# Altium schematic sheet MCU.SchDoc
size A3; Date: 9/10/2026; DrawnBy: Juan Alejandro Villodres Perdomo; Revision: 0.1; SheetNumber: 3; SheetTotal: 3
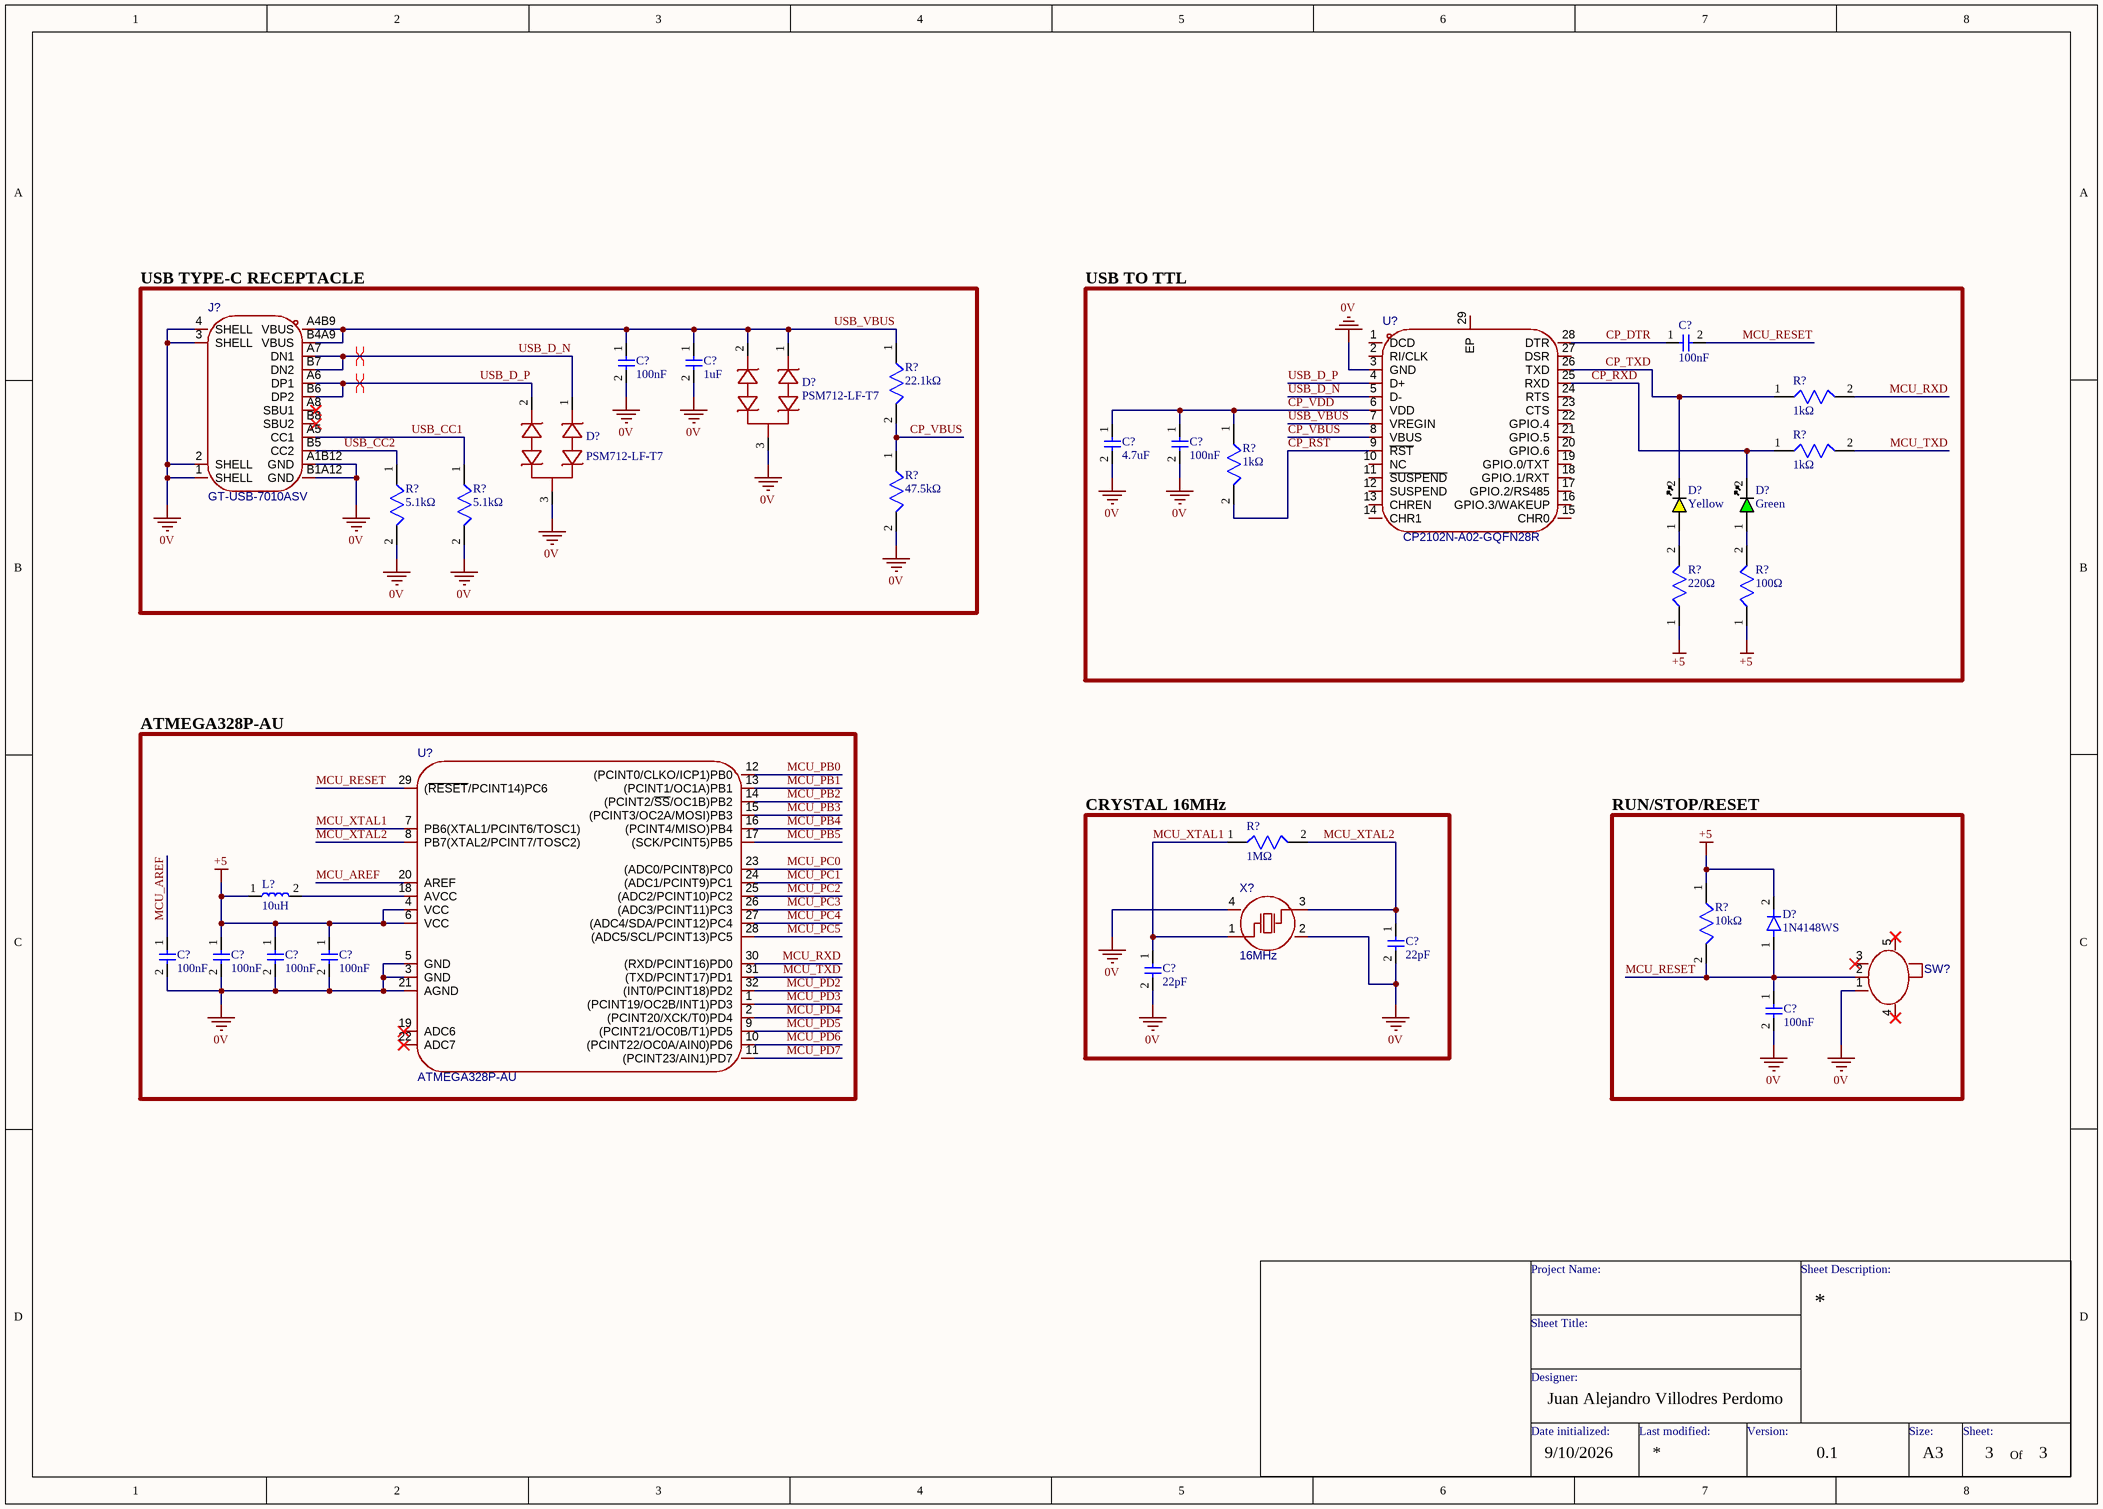
[diagram p0: MCU.SchDoc]

## Parts
(Parts that share a designator on the sheet are numbered #1, #2 ... from top to bottom, then left to right.)
C?#1  100nF  [CAPC1005X55N]
C?#2  100nF  [CAPC1608X90N]
C?#3  1uF  [CAPC1608X90N]
C?#4  4.7uF  [CAPC1005X55N]
C?#5  100nF  [CAPC1005X55N]
C?#6  22pF  [CAPC1005X55L]
C?#7  100nF  [CAPC1608X90N]
C?#8  100nF  [CAPC1608X90N]
C?#9  100nF  [CAPC1608X90N]
C?#10  100nF  [CAPC1608X90N]
C?#11  22pF  [CAPC1005X55L]
C?#12  100nF  [CAPC1608X90N]
D?#1  PSM712-LF-T7  [SOT95P230X121-3N]
D?#2  PSM712-LF-T7  [SOT95P230X121-3N]
D?#3  Yellow  [LED0805-R-RD]
D?#4  Green  [LED0805-R-RD]
D?#5  1N4148WS  [SOD-323_L1.8-W1.3-LS2.5-RD]
J?  GT-USB-7010ASV  [USB-C-SMD_G-SWITCH_GT-USB-7010ASV]
L?  10uH  [INDC3216X110N]
R?#1  22.1kΩ  [RESC1005X37N]
R?#2  1kΩ  [RESC1005X37N]
R?#3  1kΩ  [RESC1005X37N]
R?#4  1kΩ  [RESC1005X37N]
R?#5  47.5kΩ  [RESC1005X37N]
R?#6  5.1kΩ  [RESC1608X47L]
R?#7  5.1kΩ  [RESC1608X47L]
R?#8  220Ω  [RESC1608X47L]
R?#9  100Ω  [RESC1608X47L]
R?#10  1MΩ  [RESC1005X37N]
R?#11  10kΩ  [RESC1005X37N]
SW?  SS12D07VG4 087  [SW-TH_SS12D07VG4]  (value not drawn)
U?#1  CP2102N-A02-GQFN28R  [QFN-28_L5.0-W5.0-P0.50-TL-EP3.3]
U?#2  ATMEGA328P-AU  [TQFP-32_L7.0-W7.0-P0.80-LS9.0-BL]
X?  16MHz  [CRYSTAL-SMD_4P-L3.2-W2.5-BL]

## Blocks framed on the sheet
USB TYPE-C RECEPTACLE: C?#2 C?#3 D?#1 D?#2 J? R?#1 R?#5-R?#7
USB TO TTL: C?#1 C?#4 C?#5 D?#3 D?#4 R?#2-R?#4 R?#8 R?#9 U?#1
ATMEGA328P-AU: C?#7-C?#10 L? U?#2
CRYSTAL 16MHz: C?#6 C?#11 R?#10 X?
RUN/STOP/RESET: C?#12 D?#5 R?#11 SW?

## Nets
0V: C?#2.2 C?#3.2 C?#4.2 C?#5.2 C?#6.2 C?#7.2 C?#8.2 C?#9.2 C?#10.2 C?#11.2 C?#12.2 D?#1.3 D?#2.3 J?.1(SHELL) J?.2(SHELL) J?.3(SHELL) J?.4(SHELL) J?.A1B12(GND) J?.B1A12(GND) R?#5.2 R?#6.2 R?#7.2 SW?.1 U?#1.3(GND) U?#2.3(GND) U?#2.5(GND) U?#2.21(AGND) X?.2(GND) X?.4(GND)
+5: C?#8.1 C?#9.1 C?#10.1 D?#5.2(K) L?.1 R?#8.1 R?#9.1 R?#11.1 U?#2.4(VCC) U?#2.6(VCC)
CP_DTR: C?#1.1 U?#1.28(DTR)
CP_RST: R?#4.2 U?#1.9(~{RST})
CP_RXD: D?#4.2(K) R?#3.1 U?#1.25(RXD)
CP_TXD: D?#3.2(K) R?#2.1 U?#1.26(TXD)
CP_VBUS: R?#1.2 R?#5.1 U?#1.8(VBUS)
CP_VDD: C?#4.1 C?#5.1 R?#4.1 U?#1.6(VDD)
MCU_AREF: C?#7.1 U?#2.20(AREF)
MCU_PB0: U?#2.12((PCINT0/CLKO/ICP1)PB0)
MCU_PB1: U?#2.13((PCINT1/OC1A)PB1)
MCU_PB2: U?#2.14((PCINT2/~{SS}/OC1B)PB2)
MCU_PB3: U?#2.15((PCINT3/OC2A/MOSI)PB3)
MCU_PB4: U?#2.16((PCINT4/MISO)PB4)
MCU_PB5: U?#2.17((SCK/PCINT5)PB5)
MCU_PC0: U?#2.23((ADC0/PCINT8)PC0)
MCU_PC1: U?#2.24((ADC1/PCINT9)PC1)
MCU_PC2: U?#2.25((ADC2/PCINT10)PC2)
MCU_PC3: U?#2.26((ADC3/PCINT11)PC3)
MCU_PC4: U?#2.27((ADC4/SDA/PCINT12)PC4)
MCU_PC5: U?#2.28((ADC5/SCL/PCINT13)PC5)
MCU_PD2: U?#2.32((INT0/PCINT18)PD2)
MCU_PD3: U?#2.1((PCINT19/OC2B/INT1)PD3)
MCU_PD4: U?#2.2((PCINT20/XCK/T0)PD4)
MCU_PD5: U?#2.9((PCINT21/OC0B/T1)PD5)
MCU_PD6: U?#2.10((PCINT22/OC0A/AIN0)PD6)
MCU_PD7: U?#2.11((PCINT23/AIN1)PD7)
MCU_RESET: C?#1.2 C?#12.1 D?#5.1(A) R?#11.2 SW?.2 U?#2.29((~{RESET}/PCINT14)PC6)
MCU_RXD: R?#2.2 U?#2.30((RXD/PCINT16)PD0)
MCU_TXD: R?#3.2 U?#2.31((TXD/PCINT17)PD1)
MCU_XTAL1: C?#11.1 R?#10.1 U?#2.7(PB6(XTAL1/PCINT6/TOSC1)) X?.1(OSC1)
MCU_XTAL2: C?#6.1 R?#10.2 U?#2.8(PB7(XTAL2/PCINT7/TOSC2)) X?.3(OSC2)
USB_CC1: J?.A5(CC1) R?#7.1
USB_CC2: J?.B5(CC2) R?#6.1
USB_D_N: D?#2.1 J?.A7(DN1) J?.B7(DN2) U?#1.5(D-)
USB_D_P: D?#2.2 J?.A6(DP1) J?.B6(DP2) U?#1.4(D+)
USB_VBUS: C?#2.1 C?#3.1 D?#1.1 D?#1.2 J?.A4B9(VBUS) J?.B4A9(VBUS) R?#1.1 U?#1.7(VREGIN)
NetD?#3_1: D?#3.1(A) R?#8.2
NetD?#4_1: D?#4.1(A) R?#9.2
NetL?_2: L?.2 U?#2.18(AVCC)

Not connected (* = marked no-connect by the designer): J? A8(SBU1)* B8(SBU2)*; SW? 3* 4* 5*; U?#1 1(DCD) 2(RI/CLK) 10(NC) 11(~{SUSPEND}) 12(SUSPEND) 13(CHREN) 14(CHR1) 15(CHR0) 16(GPIO.3/WAKEUP) 17(GPIO.2/RS485) 18(GPIO.1/RXT) 19(GPIO.0/TXT) 20(GPIO.6) 21(GPIO.5) 22(GPIO.4) 23(CTS) 24(RTS) 27(DSR) 29(EP); U?#2 19(ADC6)* 22(ADC7)*

## Layout directives
differential pair: USB_D_N, USB_D_P

## Notes on the sheet
- Project Name:
- Sheet Description:
- Sheet Title:
- Designer:
- Date initialized:
- Last modified:
- Version:
- Size:
- A3
- Sheet:
- Of

## Library data of the parts
C?#1 C?#5 = CAP_0402_16V: Capacitor SMD 0402 / 100nF / 16V; SupplierPart: C1525
C?#2 C?#7-C?#10 C?#12 = CAP_0603_50V: Capacitor SMD 0603 / 100nF / 50V; SupplierPart: C14663
C?#3 = CAP_0603_50V: Capacitor SMD 0603 / 1uF / 50V; SupplierPart: C15849
C?#4 = CAP_0402_10V: Capacitor SMD 0402 / 4.7uF / 10V; SupplierPart: C23733
C?#6 C?#11 = CAP_0402_50V: Capacitor SMD 0402 / 22pF / 50V; SupplierPart: C1555
D?#1 D?#2 = PSM712-LF-T7: -55℃~+150℃ 12V 13.3V 19V 1uA、20uA 30A@8/20us、34A@8/20us 600W@8/20us 75pF IEC 61000-4-2、IEC 61000-4-5、IEC 61000-4-4 TVS Unidirectional SOT-23 ESD and Surge Protection (TVS/ESD) ROHS; SupplierPart: C32677
D?#3 = LED_0805_YELLOW: Lamp Holder Type:- Illumination Color:Yellow Voltage - Forward(Vf):1.8V~2.4V Voltage - Forward(Vf):1.8V~2.4V Power(Watts):40mW Forward Current:- Wavelength - Dominant:584nm~594nm Wavelength - Dominant:584nm~594nm Peak Wavelength:596nm Peak Wavelength:596n; Manufacturer: KENTO; Symbol: 17-21SUYC/TR8; Device: KT-0805Y; AddInBom: yes; ModelId: 167045bb0eae412b9d5564860e113a91ÂŽ0819f05c4eef4c71ace90d822a990e87; ModelName: LED0805-RD; ModelTransform: 79.527,49.2125,0,0,0,0,0,0,0; Power(Watts): 40mW; Peak Wavelength: 596nm; Diode Configuration: Discrete Diode; Lens Color: Water Clear; Luminous Intensity: 175mcd; Viewing Angle: 120°; LCSC Part Name: 0805 黄灯 高亮; SupplierPart: C2296; ManufacturerPart: KT-0805Y; Supplier Footprint: 0805; JLCPCB Part Class: Basic Part; Datasheet: https://item.szlcsc.com/datasheet/KT-0805Y/2669.html; Supplier: LCSC; ConvertToPcb: yes; FootprintName: LED0805-R-RD; Lamp Holder Type: -; Illumination Color: Yellow; Voltage - Forward(Vf): 1.8V~2.4V; Forward Current: -; Wavelength - Dominant: 584nm~594nm; Color Temperature: -; Mounting Style: -; Operating Temperature: -40℃~+85℃
D?#4 = LED_0805_GREEN: Lamp Holder Type:2mm x 1.25mm square LED Illumination Color:Emerald Green Voltage - Forward(Vf):2.6V~3.1V Voltage - Forward(Vf):2.6V~3.1V Power(Watts):100mW Forward Current:5mA Wavelength - Dominant:513nm~528nm Wavelength - Dominant:513nm~528nm Peak Wavel; Manufacturer: KENTO; Symbol: 0805G (Green); Device: KT-0805G; AddInBom: yes; ModelId: 167045bb0eae412b9d5564860e113a91ÂŽ0819f05c4eef4c71ace90d822a990e87; ModelName: LED0805-RD; ModelTransform: 79.527,49.2125,0,0,0,0,0,0,0; Power(Watts): 100mW; Forward Current: 5mA; Peak Wavelength: 525nm; Diode Configuration: Discrete Diode; Lens Color: Water Clear; Luminous Intensity: 430mcd; Viewing Angle: 120°; LCSC Part Name: 0805 翠绿 高亮; SupplierPart: C2297; ManufacturerPart: KT-0805G; Supplier Footprint: 0805; JLCPCB Part Class: Basic Part; Datasheet: https://item.szlcsc.com/datasheet/KT-0805G/2670.html; Supplier: LCSC; ConvertToPcb: yes; FootprintName: LED0805-R-RD; Lamp Holder Type: 2mm x 1.25mm square LED; Illumination Color: Emerald Green; Voltage - Forward(Vf): 2.6V~3.1V; Wavelength - Dominant: 513nm~528nm; Color Temperature: -; Mounting Style: -; Operating Temperature: -40℃~+85℃
D?#5 = DIODE_SMD: Diode SMD SOD-323 /; SupplierPart: C2128
J? = USB Type-C 2.0: Connector Type:Type-C Protocol Standard:USB 2.0 Gender:Female Mounting Type:Surface Mount, Right Angle Number of Contacts:16P Number of Ports:1 Current Rating-Power:3A Voltage Rating:24V Connect-Disconnect Life:10,000 cycles Center Height:1.68mm Length:7.; Manufacturer: G-Switch(品赞); AddInBom: yes; ModelId: 2daf0a05e3774c14924de84c7fbdb08dÂŽ0819f05c4eef4c71ace90d822a990e87; ModelTransform: 351.9678,311.023,0,0,0,0,0,-41.339,-59.055; Connector Type: Type-C; Protocol Standard: USB 2.0; Gender: Female; Number of Contacts: 16P; Number of Ports: 1; Current Rating-Power: 3A; Voltage Rating: 24V; Center Height: 1.68mm; Detection color: Black; Symbol: GT-USB-7010ASV; Device: GT-USB-7010ASV; LCSC Part Name: Type-C 母 卧贴; SupplierPart: C2988369; ManufacturerPart: GT-USB-7010ASV; Supplier Footprint: SMD; JLCPCB Part Class: Extended Part; Datasheet: https://item.szlcsc.com/datasheet/GT-USB-7010ASV/3445595.html; Supplier: LCSC; ConvertToPcb: yes; FootprintName: USB-C-SMD_G-SWITCH_GT-USB-7010ASV; ModelName: USB-C-SMD_G-SWITCH_GT-USB-7010ASV; Mounting Type: Surface Mount, Right Angle; Connect-Disconnect Life: 10,000 cycles; Length: 7.35mm; Operating Temperature: -40℃~+85℃
L? = IND_1206: Inductor SMD 1206 / 10uH / 25mA; SupplierPart: C1051
R?#1 = RES_0402: Resistor SMD 0402 / 22.1kΩ / 62.5mW; SupplierPart: C163478
R?#2-R?#4 = RES_0402: Resistor SMD 0402 / 1kΩ / 62.5mW; SupplierPart: C11702
R?#5 = RES_0402: Resistor SMD 0402 / 47.5kΩ / 62.5mW; SupplierPart: C2930010
R?#6 R?#7 = RES_0603: Resistor SMD 0603 / 5.1kΩ / 100mW; SupplierPart: C23186
R?#8 = RES_0603: Resistor SMD 0603 / 220Ω / 100mW; SupplierPart: C22962
R?#9 = RES_0603: Resistor SMD 0603 / 100Ω / 100mW; SupplierPart: C22775
R?#10 = RES_0402: Resistor SMD 0402 / 1MΩ / 62.5mW; SupplierPart: C26083
R?#11 = RES_0402: Resistor SMD 0402 / 10kΩ / 62.5mW; SupplierPart: C25744
SW? = Switch_5P: Circuit:SPDT Actuator Style:Rectangular Columnar Termination Style:PC Pin Length:8.7mm Width:4.4mm Switch Height:4.7mm Mounting Type:Through Hole Actuator Color:Black Current Rating:300mA Voltage Rating:50V Life:5,000 cycles Operating Force:200gf Contact; Manufacturer: SHOU HAN(首韩); AddInBom: yes; ModelId: 26966afd3ea24d04ae7f674a537ca90cÂŽ0819f05c4eef4c71ace90d822a990e87; ModelTransform: 346.456,181.102,0,180,0,0,0,0,-110.236; Circuit: SPDT; Switch Height: 4.7mm; Actuator Color: Black; Current Rating: 300mA; Voltage Rating: 50V; Operating Force: 200gf; Actuator Length: 2mm; Symbol: SS12D07VG4 087; Device: SS12D07VG4 087; LCSC Part Name: 垂直滑动开关; SupplierPart: C2939726; ManufacturerPart: SS12D07VG4 087; Supplier Footprint: 插件,8.7x4.4mm; JLCPCB Part Class: Extended Part; Datasheet: https://item.szlcsc.com/datasheet/SS12D07VG4%2520087/3301205.html; Supplier: LCSC; ConvertToPcb: yes; FootprintName: SW-TH_SS12D07VG4; ModelName: SW-TH_SS12D07VG4; Actuator Style: Rectangular Columnar; Termination Style: PC Pin; Length: 8.7mm; Width: 4.4mm; Mounting Type: Through Hole; Life: 5,000 cycles; Contact Material: 磷青铜; Contact Finish: Silver; Operating Temperature: -10℃~+50℃
U?#1 = CP2102N-A02-GQFN28R: Applications Function:USB to UART USB Protocol:USB 2.0 Number of Channels:- Voltage - Supply:3V~3.6V Voltage - Supply:3V~3.6V Data Rate:- Operating Temperature:-40℃~+85℃@(Ta) Operating Temperature:-40℃~+85℃@(Ta) Current - Supply:9.5mA Quiescent Supply Cur; Manufacturer: SKYWORKS/SILICON LABS(芯科); AddInBom: yes; ModelId: 5bc86717285743f3be440a5340f9f4c7ÂŽ0819f05c4eef4c71ace90d822a990e87; ModelName: QFN-28_L5.0-W5.0-H0.9-P0.50; ModelTransform: 196.85,196.85,0,0,0,0,0,0,0; USB Protocol: USB 2.0; Current - Supply: 9.5mA; Quiescent Supply Current: 1.3uA; Symbol: CP2102N-A02-GQFN28R; Device: CP2102N-A02-GQFN28R; LCSC Part Name: USB转UART桥接器; SupplierPart: C964632; ManufacturerPart: CP2102N-A02-GQFN28R; Supplier Footprint: QFN-28-EP(5x5); JLCPCB Part Class: Extended Part; Datasheet: https://item.szlcsc.com/datasheet/CP2102N-A02-GQFN28R/1049893.html; Supplier: LCSC; ConvertToPcb: yes; FootprintName: QFN-28_L5.0-W5.0-P0.50-TL-EP3.3; Applications Function: USB to UART; Number of Channels: -; Voltage - Supply: 3V~3.6V; Data Rate: -; Operating Temperature: -40℃~+85℃@(Ta); Features: FIFO buffer；Programmable baud rate；Wake-up function；Built-in clock generator；Hardware flow control support；Power-on reset
U?#2 = ATMEGA328P-AU: CPU Core:AVR CPU Maximum Speed:20MHz Core Size:8 Bit Program Storage Size:32KB Program Memory Type:FLASH RAM Size:2KB EEPROM:1KB Number of I/O:23 ADC (Bit):10bit Oscillator Type:Built-in Voltage - Supply:1.8V~5.5V Voltage - Supply:1.8V~5.5V Operating Temp; Manufacturer: MICROCHIP(美国微芯); Device: ATMEGA328P-AU_C14877; AddInBom: yes; ModelId: 6ff4c81e2a3d47d29b7f8663c943769eÂŽ0819f05c4eef4c71ace90d822a990e87; ModelName: TQFP-32_L7.0-W7.0-H1.2-LS9.0-P0.80; ModelTransform: 354.98382,354.98386,0,90,0,0,-0.039,0.079,0; CPU Core: AVR; CPU Maximum Speed: 20MHz; Core Size: 8 Bit; Program Storage Size: 32KB; Program Memory Type: FLASH; RAM Size: 2KB; EEPROM: 1KB; Number of I/O: 23; ADC (Bit): 10bit; Symbol: ATMEGA328P-AU; LCSC Part Name: 基于AVR增强型RISC架构的低功耗CMOS 8位微控制器; SupplierPart: C14877; ManufacturerPart: ATMEGA328P-AU; Supplier Footprint: TQFP-32(7x7); JLCPCB Part Class: Extended Part; Datasheet: https://item.szlcsc.com/datasheet/ATMEGA328P-AU/15549.html; Supplier: LCSC; ConvertToPcb: yes; FootprintName: TQFP-32_L7.0-W7.0-P0.80-LS9.0-BL; Oscillator Type: Built-in; Voltage - Supply: 1.8V~5.5V; Operating Temperature: -40℃~+85℃; Features: External pin reset (NRST)；Built-in general-purpose timer；Power-on reset (POR)；Touch function；Undervoltage detection (BOR/LVD/LVR/LVI)；Programmable watchdog
X? = X322516MLB4SI: Type:Crystal Oscillator Frequency:16MHz Normal temperature Frequency Tolerance:±10ppm Normal temperature Frequency Tolerance:±10ppm Load Capacitance:9pF Frequency Stability:±20ppm Frequency Stability:±20ppm Equivalent Series Resistance(ESR):50Ω Operating; Manufacturer: YXC(扬兴晶振); AddInBom: yes; ModelId: a2b47bc5d32f4dfd996128e047b549a0ÂŽ0819f05c4eef4c71ace90d822a990e87; ModelTransform: 125.984,98.425,0,0,0,0,0,0,0; Normal temperature Frequency Tolerance: ±10ppm; Load Capacitance: 9pF; Frequency Stability: ±20ppm; Equivalent Series Resistance(ESR): 50Ω; Symbol: X322516MLB4SI; Device: X322516MLB4SI; LCSC Part Name: YSX321SL 16MHZ 4P 3225 9PF ±10PPM -40~85℃ (±20PPM); SupplierPart: C13738; ManufacturerPart: X322516MLB4SI; Supplier Footprint: SMD3225-4P; JLCPCB Part Class: Basic Part; Datasheet: https://item.szlcsc.com/datasheet/X322516MLB4SI/14393.html; Supplier: LCSC; ConvertToPcb: yes; FootprintName: CRYSTAL-SMD_4P-L3.2-W2.5-BL; ModelName: CRYSTAL-SMD_4P-L3.2-W2.5-BL; Type: Crystal Oscillator; Value: 16MHz; Operating Temperature: -40℃~+85℃